# Altium project AHPR_Sensor_Board.PrjPcb
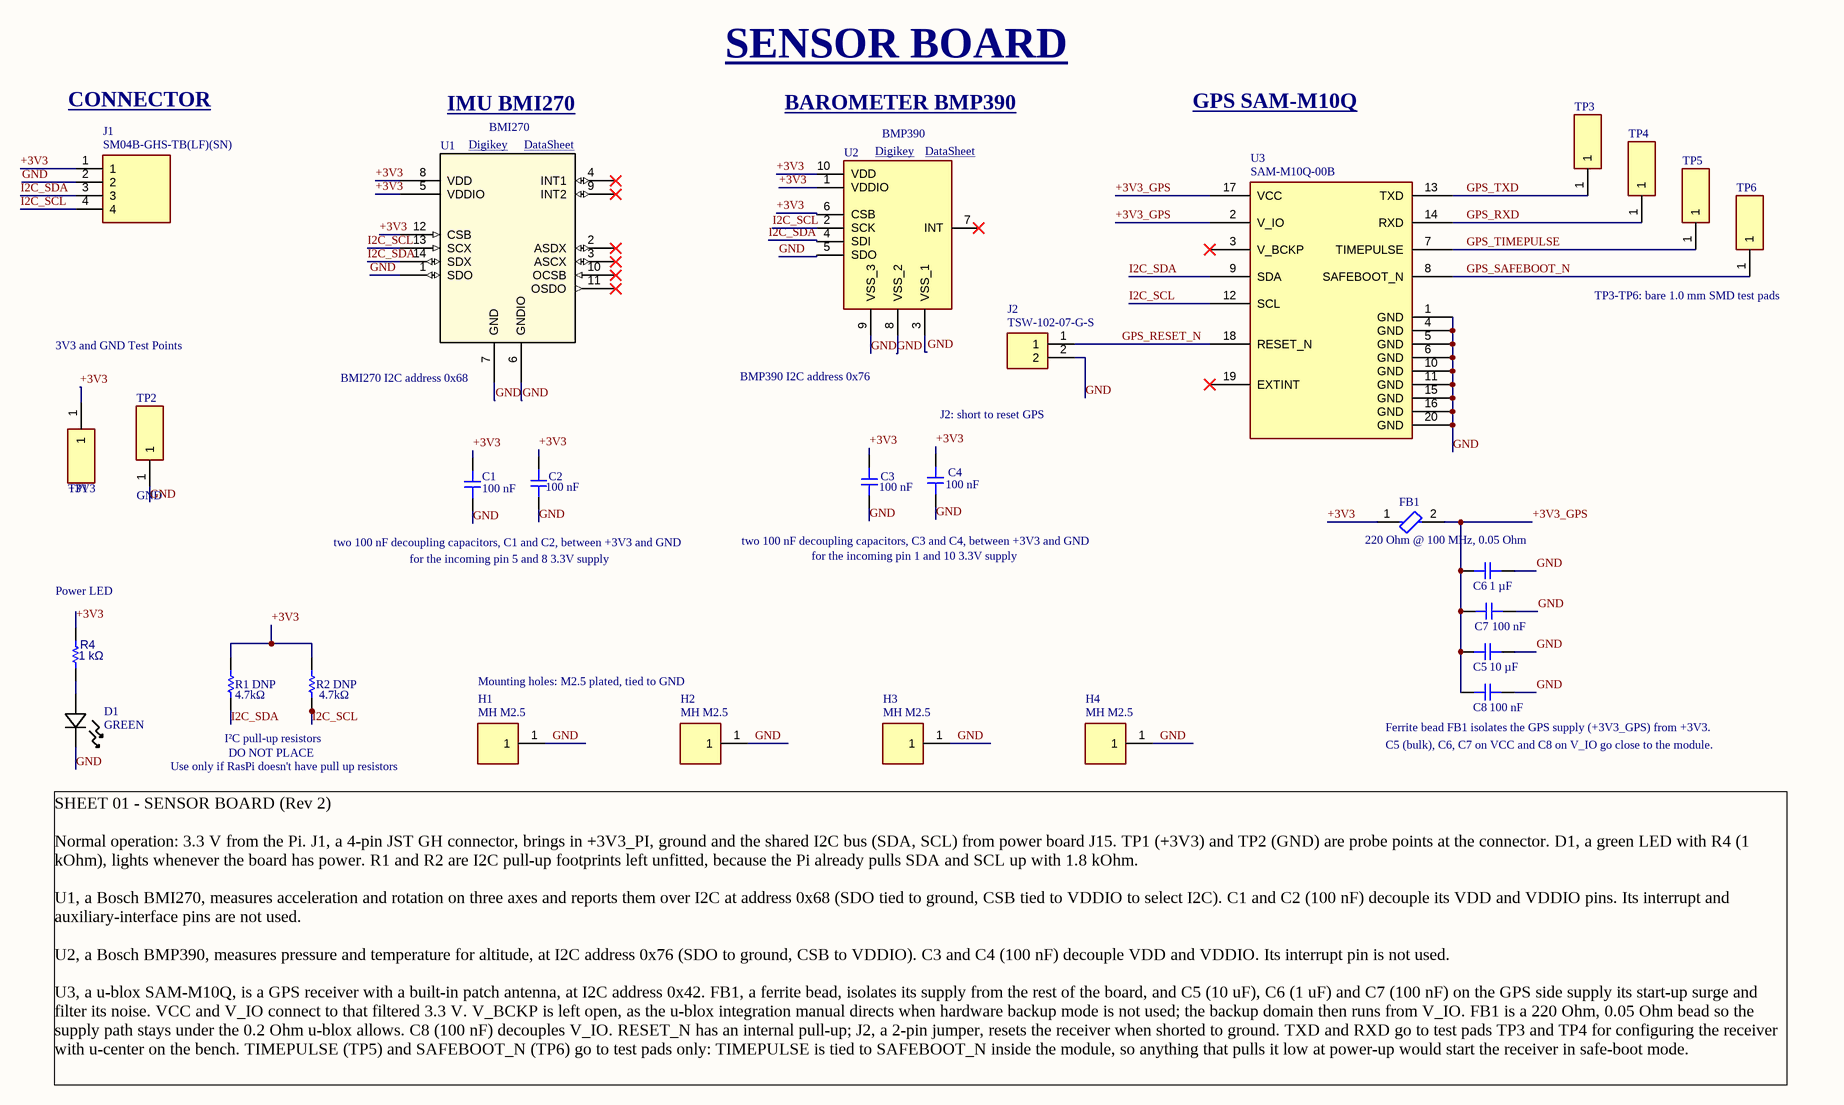
[diagram p0: AHPR_Sensor_Board.SchDoc]
1 sheet, 28 parts. Net scope: global (net labels, ports and power ports of the same name join across sheets).
Board file: AHPR_Sensor_Board.PcbDoc

## Sheet AHPR_Sensor_Board.SchDoc
size 431 x 279 mm; SheetNumber: 1; SheetTotal: 1

### Parts
C1  100 nF  [CAPC1608X90N]
C2  100 nF  [CAPC1608X90N]
C3  100 nF  [CAPC1608X90N]
C4  100 nF  [CAPC1608X90N]
C5  10 µF  [CAP_GRM21_2p15X1p4X1p4_MUR]
C6  1 µF  [G-188_MUR]
C7  100 nF  [CAPC1608X90N]
C8  100 nF  [CAPC1608X90N]
D1  GREEN  [LED_LTST-C191KGKT_LTO]
FB1  220 Ohm @ 100 MHz, 0.05 Ohm  [FP-BLM18-0_15-t0_8-MFG]
H1  MH M2.5  [MH_M2.5_PLATED]
H2  MH M2.5  [MH_M2.5_PLATED]
H3  MH M2.5  [MH_M2.5_PLATED]
H4  MH M2.5  [MH_M2.5_PLATED]
J1  SM04B-GHS-TB(LF)(SN)  [JST_SM04B-GHS-TB]
J2  TSW-102-07-G-S  [FP-TSW-102-07-G-S-MFG]
R1_DNP  4.7kΩ  [RES_0603]
R2_DNP  4.7kΩ  [RES_0603]
R4  1 kΩ  [RES_0603-Footprint-1]
TP1  +3V3  [5015]
TP2  GND  [5015]
TP3  TXD  [5015]  (value not drawn)
TP4  RXD  [5015]  (value not drawn)
TP5  TIMEPULSE  [5015]  (value not drawn)
TP6  SAFEBOOT_N  [5015]  (value not drawn)
U1  BMI270  [BMI270_BOS]
U2  BMP390  [BMP390]
U3  SAM-M10Q-00B  [SAM-M10Q_UBL]

### Nets
+3V3: C1.2 C2.2 C3.2 C4.2 FB1.1 J1.1 R1_DNP.2 R2_DNP.2 R4.1 TP1.1 U1.5(VDDIO) U1.8(VDD) U1.12(CSB) U2.1(VDDIO) U2.6(CSB) U2.10(VDD)
+3V3_GPS: C5.2 C6.2 C7.2 C8.2 FB1.2 U3.2(V_IO) U3.17(VCC)
GND: C1.1 C2.1 C3.1 C4.1 C5.1 C6.1 C7.1 C8.1 D1.1 H1.1 H2.1 H3.1 H4.1 J1.2 J2.2 TP2.1 U1.1(SDO) U1.6(GNDIO) U1.7(GND) U2.3(VSS_1) U2.5(SDO) U2.8(VSS_2) U2.9(VSS_3) U3.1(GND) U3.4(GND) U3.5(GND) U3.6(GND) U3.10(GND) U3.11(GND) U3.15(GND) U3.16(GND) U3.20(GND)
GPS_RESET_N: J2.1 U3.18(RESET_N)
GPS_RXD: TP4.1 U3.14(RXD)
GPS_SAFEBOOT_N: TP6.1 U3.8(SAFEBOOT_N)
GPS_TIMEPULSE: TP5.1 U3.7(TIMEPULSE)
GPS_TXD: TP3.1 U3.13(TXD)
I2C_SCL: J1.4 R2_DNP.1 U1.13(SCX) U2.2(SCK) U3.12(SCL)
I2C_SDA: J1.3 R1_DNP.1 U1.14(SDX) U2.4(SDI) U3.9(SDA)
NetD1_2: D1.2 R4.2

Not connected (* = marked no-connect by the designer): U1 2(ASDX)* 3(ASCX)* 4(INT1)* 9(INT2)* 10(OCSB)* 11(OSDO)*; U2 7(INT)*; U3 3(V_BCKP)* 19(EXTINT)*

### Notes on the sheet
- SENSOR BOARD
- CONNECTOR
- IMU BMI270
- (near U1) Digikey <https://www.digikey.com/en/products/detail/bosch-sensortec/BMI270/9974486>
- (near U1) DataSheet <https://www.bosch-sensortec.com/media/boschsensortec/downloads/datasheets/bst-bmi270-ds000.pdf>
- BAROMETER BMP390
- (near U2) Digikey <https://www.digikey.com/en/products/detail/bosch-sensortec/BMP390/16164575>
- (near U2) DataSheet <https://www.bosch-sensortec.com/media/boschsensortec/downloads/datasheets/bst-bmp390-ds002.pdf>
- GPS SAM-M10Q
- (near TP6) TP3-TP6: bare 1.0 mm SMD test pads
- 3V3 and GND Test Points
- (near U1) BMI270 I2C address 0x68
- BMP390 I2C address 0x76
- J2: short to reset GPS
- two 100 nF decoupling capacitors, C1 and C2, between +3V3 and GND
- for the incoming pin 5 and 8 3.3V supply
- two 100 nF decoupling capacitors, C3 and C4, between +3V3 and GND
- for the incoming pin 1 and 10 3.3V supply
- (near R4) Power LED
- Mounting holes: M2.5 plated, tied to GND
- Use only if RasPi doesn't have pull up resistors
- I²C pull-up resistors
- DO NOT PLACE
- (near C8) Ferrite bead FB1 isolates the GPS supply (+3V3_GPS) from +3V3.
- (near C8) C5 (bulk), C6, C7 on VCC and C8 on V_IO go close to the module.
- SHEET 01 - SENSOR BOARD (Rev 2)
  Normal operation: 3.3 V from the Pi. J1, a 4-pin JST GH connector, brings in +3V3_PI, ground and the shared I2C bus (SDA, SCL) from power board J15. TP1 (+3V3) and TP2 (GND) are probe points at the connector. D1, a green LED with R4 (1 kOhm), lights whenever the board has power. R1 and R2 are I2C pull-up footprints left unfitted, because the Pi already pulls SDA and SCL up with 1.8 kOhm.
  U1, a Bosch BMI270, measures acceleration and rotation on three axes and reports them over I2C at address 0x68 (SDO tied to ground, CSB tied to VDDIO to select I2C). C1 and C2 (100 nF) decouple its VDD and VDDIO pins. Its interrupt and auxiliary-interface pins are not used.
  U2, a Bosch BMP390, measures pressure and temperature for altitude, at I2C address 0x76 (SDO to ground, CSB to VDDIO). C3 and C4 (100 nF) decouple VDD and VDDIO. Its interrupt pin is not used.
  U3, a u-blox SAM-M10Q, is a GPS receiver with a built-in patch antenna, at I2C address 0x42. FB1, a ferrite bead, isolates its supply from the rest of the board, and C5 (10 uF), C6 (1 uF) and C7 (100 nF) on the GPS side supply its start-up surge and filter its noise. VCC and V_IO connect to that filtered 3.3 V. V_BCKP is left open, as the u-blox integration manual directs when hardware backup mode is not used; the backup domain then runs from V_IO. FB1 is a 220 Ohm, 0.05 Ohm bead so the supply path stays under the 0.2 Ohm u-blox allows. C8 (100 nF) decouples V_IO. RESET_N has an internal pull-up; J2, a 2-pin jumper, resets the receiver when shorted to ground. TXD and RXD go to test pads TP3 and TP4 for configuring the receiver with u-center on the bench. TIMEPULSE (TP5) and SAFEBOOT_N (TP6) go to test pads only: TIMEPULSE is tied to SAFEBOOT_N inside the module, so anything that pulls it low at power-up would start the receiver in safe-boot mode.
- DWG. NO.
- REV.
- SHT.
- THIS DOCUMENT AND THE DATA DISCLOSED HEREIN OR HEREWITH IS THE PROPERTY OF ALTIUM LIMITED AND MAY BE FREELY DISTRIBUTED IN WHOLE. NO RIGHTS ARE RESERVED OR EXPRESS OR IMPLIED WARANTEE GIVEN.
- REVISION
- DESCRIPTION
- DATE
- APPROVED
- ENG:
- APPROVALS
- PROJECT
- DSN:
- CHK:
- REFERENCE DOCUMENTS
- PROJECT REVISION:
- TITLE
- DOCUMENT REVISION:
- DESIGN ITEM:
- BOM:
- FAB DWG:
- PCB DWG:
- ASSY DWG:
- SCALE:
- SIZE
- B
- CAGE CODE
- FILE NAME
- DWG NO.
- SHEET
- OF
- REV

### Library data of the parts
C1-C4 C7 C8 = CMP-001-00119-1: Ceramic capacitor, 100 nF, 50 V, X7R, 10%, 0603; Manufacturer_Part_Number: GRM188R71H104KA93D; Design Item ID: CAP_0402; Source: Generic_Schematic_Library.SchLib
C5 = CMP-001-00119-1: Ceramic capacitor, 10 uF, 10 V, X7R, 10%, 0805; Manufacturer_Part_Number: GRM21BR71A106KA73L; Design Item ID: CAP_0402; Source: Generic_Schematic_Library.SchLib
C6 = CMP-001-00119-1: Ceramic capacitor, 1 uF, 10 V, X7R, 10%, 0603; Manufacturer_Part_Number: GRM188R71A105KA61D; Design Item ID: CAP_0402; Source: Generic_Schematic_Library.SchLib
D1 = LTST-C190KGKT: LED, green, 0603, low profile (LTST-C191KGKT); Manufacturer_Name: LITE-ON; Copyright: Copyright (C) 2025 Ultra Librarian. All rights reserved.; Manufacturer_Part_Number: LTST-C191KGKT
FB1 = CMP-0686-00436-3: Chip ferrite bead, 220 Ohm @ 100 MHz, 0.05 Ohm DCR, 0603; Manufacturer_Part_Number: BLM18KG221SN1D; Number of Lines: 1; Frequency: 100MHz; Impedance: 220R; DC Resistance (DCR): 50mR; Shielding: Unshielded; Termination: SMD/SMT; Military Standard: Not; Number of Circuits: 1; Min Operating Temperature: -55°C; Case Code (Imperial): 0603; Width: 0.8mm; Lead Free: Lead Free; Packaging: Tape and Reel; Max Operating Temperature: 125°C; REACH SVHC: No SVHC; Case/Package: 0603; Package Quantity: 1; Height: 0.8mm; Number of Pins: 2; Depth: 0.8mm; Test Frequency: 100MHz; Case Code (Metric): 1608; Core Material: Ferrite; Radiation Hardening: No; Length: 1.6mm; RoHS Compliant: Yes
H1-H4 = MH_M2.5: M2.5 plated mounting hole tied to GND (2.75 mm hole, 6 mm pad)
J1 = BM04B-GHS-TBT: JST GH 4-pin header, 1.25 mm pitch, right angle, SMD (3V3 / GND / SDA / SCL); Manufacturer_Part_Number: SM04B-GHS-TB(LF)(SN)
J2 = TSW-102-07-G-S: Samtec 2-pin header, 2.54 mm pitch, vertical (GPS reset); Manufacturer_Part_Number: TSW-102-07-G-S
R1_DNP R2_DNP = CMP-009-00225-1: Thick-film resistor, 4.7 kOhm, 1%, 0.1 W, 0603 (I2C pull-up, not fitted); Manufacturer Part Number: RC0603FR-074K7L; Design Item ID: RES_0603; Source: Generic_Schematic_Library.SchLib
R4 = CMP-009-00014-9: Thick-film resistor, 1 kOhm, 1%, 0.1 W, 0603 (LED current limit); Manufacturer_Part_Number: RC0603FR-071KL; Voltage Rating: 50V; Power: 100mW; Tolerance: 1%; RoHS Compliant: True; Min Operating Temperature: -55°C; Case/Package: 0603; Pins: 2; Max Operating Temperature: 155°C; Mounting Technology: SM
TP1 = 5015: Test point, SMD (Keystone 5015), +3V3; Manufacturer_Name: Keystone Electronics; Geometry.Height: 1.52mm; Manufacturer_Part_Number: 5015; Mouser Part Number: 534-5015; Mouser Price/Stock: https://www.mouser.co.uk/ProductDetail/Keystone-Electronics/5015?qs=qOqV1E1P08ShW56PtUq2FA%3D%3D; Arrow Part Number: 5015; Arrow Price/Stock: https://www.arrow.com/en/products/5015/keystone-electronics.html?utm_currency=USD&region=europe; Datasheet Link: http://www.keyelco.com/product-pdf.cfm?p=1353
TP2 = 5015: Test point, SMD (Keystone 5015), GND; Manufacturer_Name: Keystone Electronics; Geometry.Height: 1.52mm; Manufacturer_Part_Number: 5015; Mouser Part Number: 534-5015; Mouser Price/Stock: https://www.mouser.co.uk/ProductDetail/Keystone-Electronics/5015?qs=qOqV1E1P08ShW56PtUq2FA%3D%3D; Arrow Part Number: 5015; Arrow Price/Stock: https://www.arrow.com/en/products/5015/keystone-electronics.html?utm_currency=USD&region=europe; Datasheet Link: http://www.keyelco.com/product-pdf.cfm?p=1353
TP3-TP6 = 5015: Bare SMD copper test pad, part of the PCB; Manufacturer_Name: Keystone Electronics; Geometry.Height: 1.52mm; Manufacturer_Part_Number: 5015; Mouser Part Number: 534-5015; Mouser Price/Stock: https://www.mouser.co.uk/ProductDetail/Keystone-Electronics/5015?qs=qOqV1E1P08ShW56PtUq2FA%3D%3D; Arrow Part Number: 5015; Arrow Price/Stock: https://www.arrow.com/en/products/5015/keystone-electronics.html?utm_currency=USD&region=europe; Datasheet Link: http://www.keyelco.com/product-pdf.cfm?p=1353
U1 = BMI270: Bosch BMI270 6-axis IMU (accelerometer + gyroscope), I2C 0x68, LGA-14; Manufacturer_Name: Bosch Sensortec; Copyright: Copyright (C) 2025 Ultra Librarian. All rights reserved.; Manufacturer_Part_Number: BMI270
U2 = BMP390: Bosch BMP390 barometric pressure and temperature sensor, I2C 0x76, LGA-10; Geometry.Height: 0.8mm; Manufacturer_Name: BOSCH; Manufacturer_Part_Number: BMP390; Mouser Part Number: 262-BMP390; Mouser Price/Stock: https://www.mouser.co.uk/ProductDetail/Bosch-Sensortec/BMP390?qs=QNEnbhJQKvYQVfvRMgo2YA%3D%3D; Arrow Part Number: BMP390; Arrow Price/Stock: https://www.arrow.com/en/products/bmp390/bosch-sensortec.html?utm_currency=USD&region=nac; Datasheet Link: https://www.bosch-sensortec.com/media/boschsensortec/downloads/datasheets/bst-bmp390-ds002.pdf
U3 = SAM-M10Q: u-blox SAM-M10Q GNSS module with integrated patch antenna, I2C 0x42; Manufacturer_Part_Number: SAM-M10Q-00B